# Altium project project1_power_supply.PrjPcb
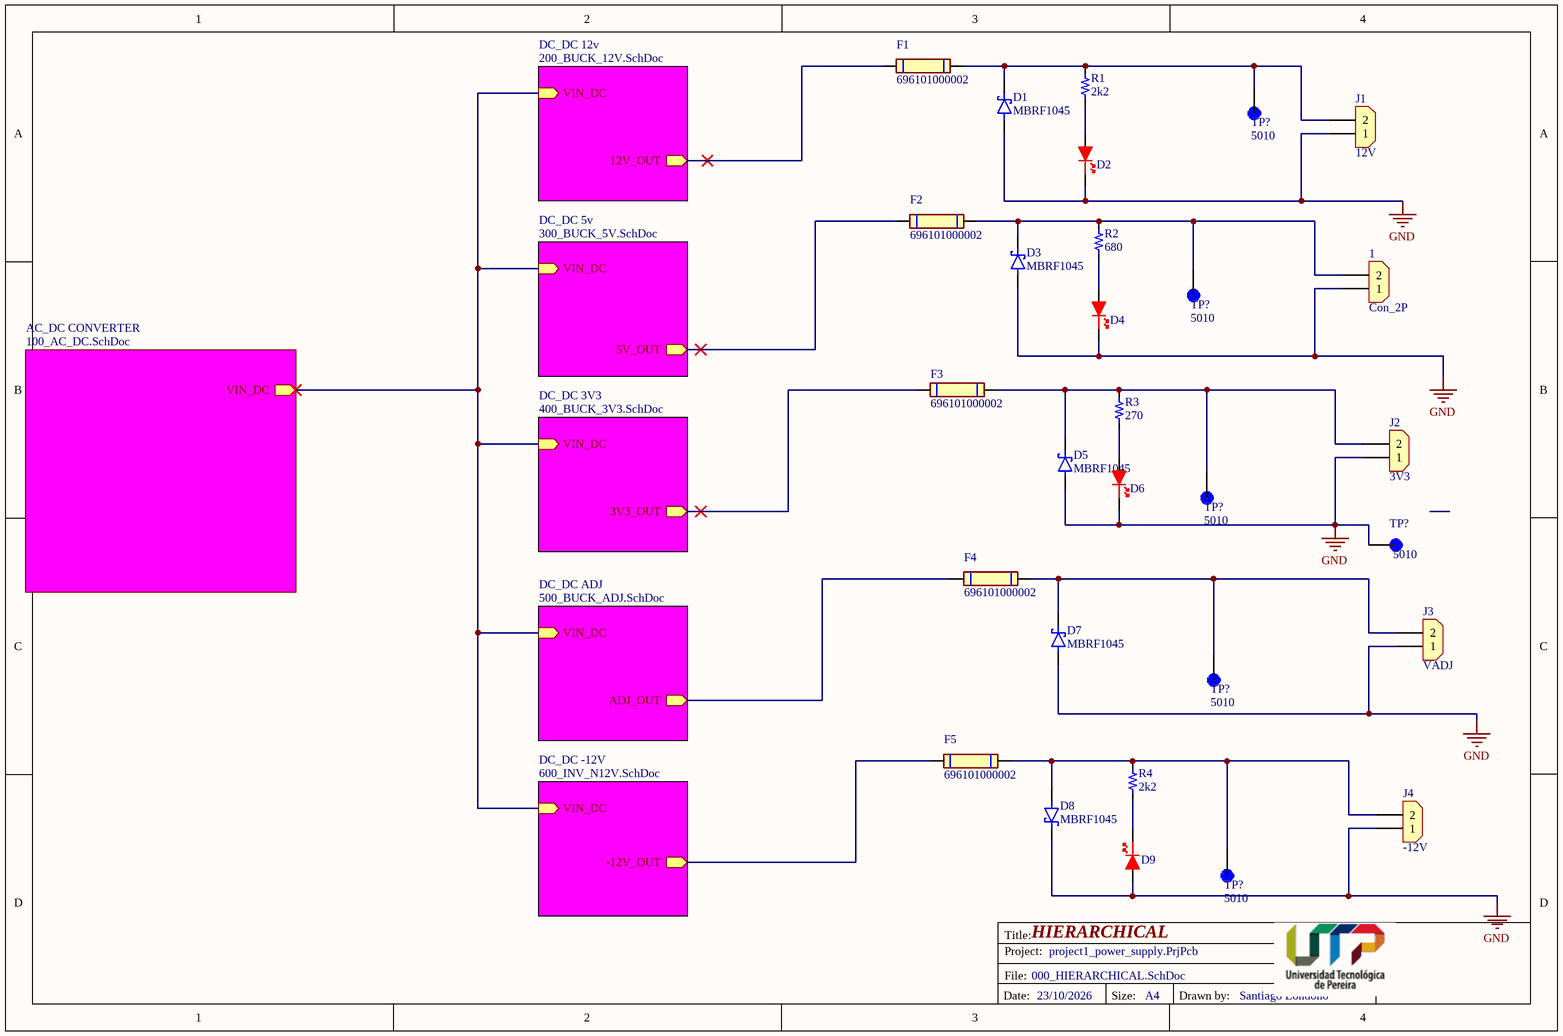
[diagram p0: 000_HIERARCHICAL.SchDoc]
Author: Santiago Londoño
7 sheets, 97 parts. Net scope: hierarchical (ports join the sheet entries above them; power ports are global).
Board file: Main_PCB_V1R0_XXXXXX.PcbDoc
Sheets:
  000_HIERARCHICAL.SchDoc
    AC_DC CONVERTER = 100_AC_DC.SchDoc
    DC_DC 12v = 200_BUCK_12V.SchDoc
    DC_DC 5v = 300_BUCK_5V.SchDoc
    DC_DC 3V3 = 400_BUCK_3V3.SchDoc
    DC_DC ADJ = 500_BUCK_ADJ.SchDoc
    DC_DC -12V = 600_INV_N12V.SchDoc

## Sheet 000_HIERARCHICAL.SchDoc: HIERARCHICAL
size A4; Date: 23/10/2026; DrawnBy: Santiago Londoño; SheetNumber: 0; SheetTotal: 8

### Parts
(Parts that share a designator on the sheet are numbered #1, #2 ... from top to bottom, then left to right.)
1  Con_2P  [CON_2x1_TH_3.5mm_TB]
D1  MBRF1045  [TO508P995X450X1960-2]
D2  LED  [LED_5MM]  (value not drawn)
D3  MBRF1045  [TO508P995X450X1960-2]
D4  LED  [LED_5MM]  (value not drawn)
D5  MBRF1045  [TO508P995X450X1960-2]
D6  LED  [LED_5MM]  (value not drawn)
D7  MBRF1045  [TO508P995X450X1960-2]
D8  MBRF1045  [TO508P995X450X1960-2]
D9  LED  [LED_5MM]  (value not drawn)
F1  696101000002  [696101000002]
F2  696101000002  [696101000002]
F3  696101000002  [696101000002]
F4  696101000002  [696101000002]
F5  696101000002  [696101000002]
J1  12V  [CON_2x1_TH_3.5mm_TB]
J2  3V3  [CON_2x1_TH_3.5mm_TB]
J3  VADJ  [CON_2x1_TH_3.5mm_TB]
J4  -12V  [CON_2x1_TH_3.5mm_TB]
R1  value 2k2  [0603]  (hidden comment: 2k2 1/10W)
R2  value 680  [0603]  (hidden comment: 2k2 1/10W)
R3  value 270  [0603]  (hidden comment: 2k2 1/10W)
R4  value 2k2  [0603]  (hidden comment: 2k2 1/10W)
TP?#1  5010  [TP_5010]
TP?#2  5010  [TP_5010]
TP?#3  5010  [TP_5010]
TP?#4  5010  [TP_5010]
TP?#5  5010  [TP_5010]
TP?#6  5010  [TP_5010]

### Sub-sheets
AC_DC CONVERTER = 100_AC_DC.SchDoc: VIN_DC (out)
DC_DC 3V3 = 400_BUCK_3V3.SchDoc: VIN_DC (in), 3V3_OUT (out)
DC_DC 5v = 300_BUCK_5V.SchDoc: VIN_DC (in), 5V_OUT (out)
DC_DC 12v = 200_BUCK_12V.SchDoc: VIN_DC (in), 12V_OUT (out)
DC_DC -12V = 600_INV_N12V.SchDoc: VIN_DC (in), -12V_OUT (out)
DC_DC ADJ = 500_BUCK_ADJ.SchDoc: VIN_DC (in), ADJ_OUT (out)

### Nets
GND: 1.1 D1.2(A) D2.K D3.2(A) D4.K D5.2(A) D6.K D7.2(A) D8.1(K) D9.A J1.1 J2.1 J3.1 J4.1 TP?#4.TP
3V3_INT: F3.2 ; sheet DC_DC 3V3/3V3_OUT
Net1_2: 1.2 D3.1(K) F2.2 R2.2 TP?#2.TP
NetC100_1: sheet AC_DC CONVERTER/VIN_DC, sheet DC_DC 12v/VIN_DC, sheet DC_DC 5v/VIN_DC, sheet DC_DC 3V3/VIN_DC, sheet DC_DC ADJ/VIN_DC, sheet DC_DC -12V/VIN_DC
NetC201_P: F1.1 ; sheet DC_DC 12v/12V_OUT
NetC301_P: F2.1 ; sheet DC_DC 5v/5V_OUT
NetC501_P: F4.1 ; sheet DC_DC ADJ/ADJ_OUT
NetC602_N: F5.1 ; sheet DC_DC -12V/-12V_OUT
NetD1_1: D1.1(K) F1.2 J1.2 R1.2 TP?#1.TP
NetD2_A: D2.A R1.1
NetD4_A: D4.A R2.1
NetD5_1: D5.1(K) F3.1 J2.2 R3.2 TP?#3.TP
NetD6_A: D6.A R3.1
NetD7_1: D7.1(K) F4.2 J3.2 TP?#5.TP
NetD8_2: D8.2(A) F5.2 J4.2 R4.2 TP?#6.TP
NetD9_K: D9.K R4.1

### Notes on the sheet
- Title:
- Project:
- File:
- Revision:
- Date:
- Size:
- A4
- Drawn by:

### Library data of the parts
1 J1-J4 = Con_2x1_TH_3.5mm: TERM BLK 2POS SIDE ENT 3.5MM PCB; Manufacturer: Würth Elektronik; Manufacturer Part Number: 691214110002; Supplier 1: Digi-Key; Supplier Part Number 1: 732-2747-ND; Last modified by: J.Jaramillo; Last modified date: 20240310; ComponentLink1Description: Digi-key; ComponentLink1URL: https://www.digikey.com/product-detail/en/wurth-electronics-inc/691214110002/732-2747-ND/2508516; Reel Stock: N/A
D2 D4 D6 D9 = LED_5MM_GENERIC_THT: 5mm LED Generic THT
F1-F5 = 696101000002: MF: {'manufacturer': u'W\xfcrth Elektronik'}; Package: None; Price: None; Value: *; MP: 696101000002; Availability: Unavailable
R1-R4 = Res_2k2_0603_1/10W: RES SMD 2.2K OHM 1% 1/10W 0603; Manufacturer: Yageo; Manufacturer Part Number: RC0603FR-072K2L; Reel Stock: N/A; Last modified by: J.Jaramillo; Last modified date: 20240310; ComponentLink1Description: Digi-Key; ComponentLink1URL: https://www.digikey.com/en/products/detail/yageo/RC0603FR-072K2L/727016?s=N4IgTCBcDaIEoGEAMA2JBmAYnAtEg7GANJgAyIAugL5A; Supplier 1: Digi-Key; Supplier Part Number 1: 311-2.20KHRCT-ND
TP?#1-TP?#6 = 5010: Test Point MultiPurpose THM .445 L .125 OD Heat Resistant Nylon 46 Red | Keystone Electronics 5010; SnapEDA_Link: https://www.snapeda.com/parts/5010/Keystone/view-part/?ref=snap; Package: NON STANDARD-1 Keystone; Value: *; MF: Keystone Electronics; MP: 5010; Check_prices: https://www.snapeda.com/parts/5010/Keystone/view-part/?ref=eda
D1 D3 D5 D7 D8 = MBRF1045: Availability: Unavailable; Value: *; Package: None; MP: MBRF1045; Price: None

## Sheet 100_AC_DC.SchDoc: ETAPA AC_DC
size A4; Date: 23/10/2026; DrawnBy: Santiago Londoño; SheetNumber: 1; SheetTotal: 8
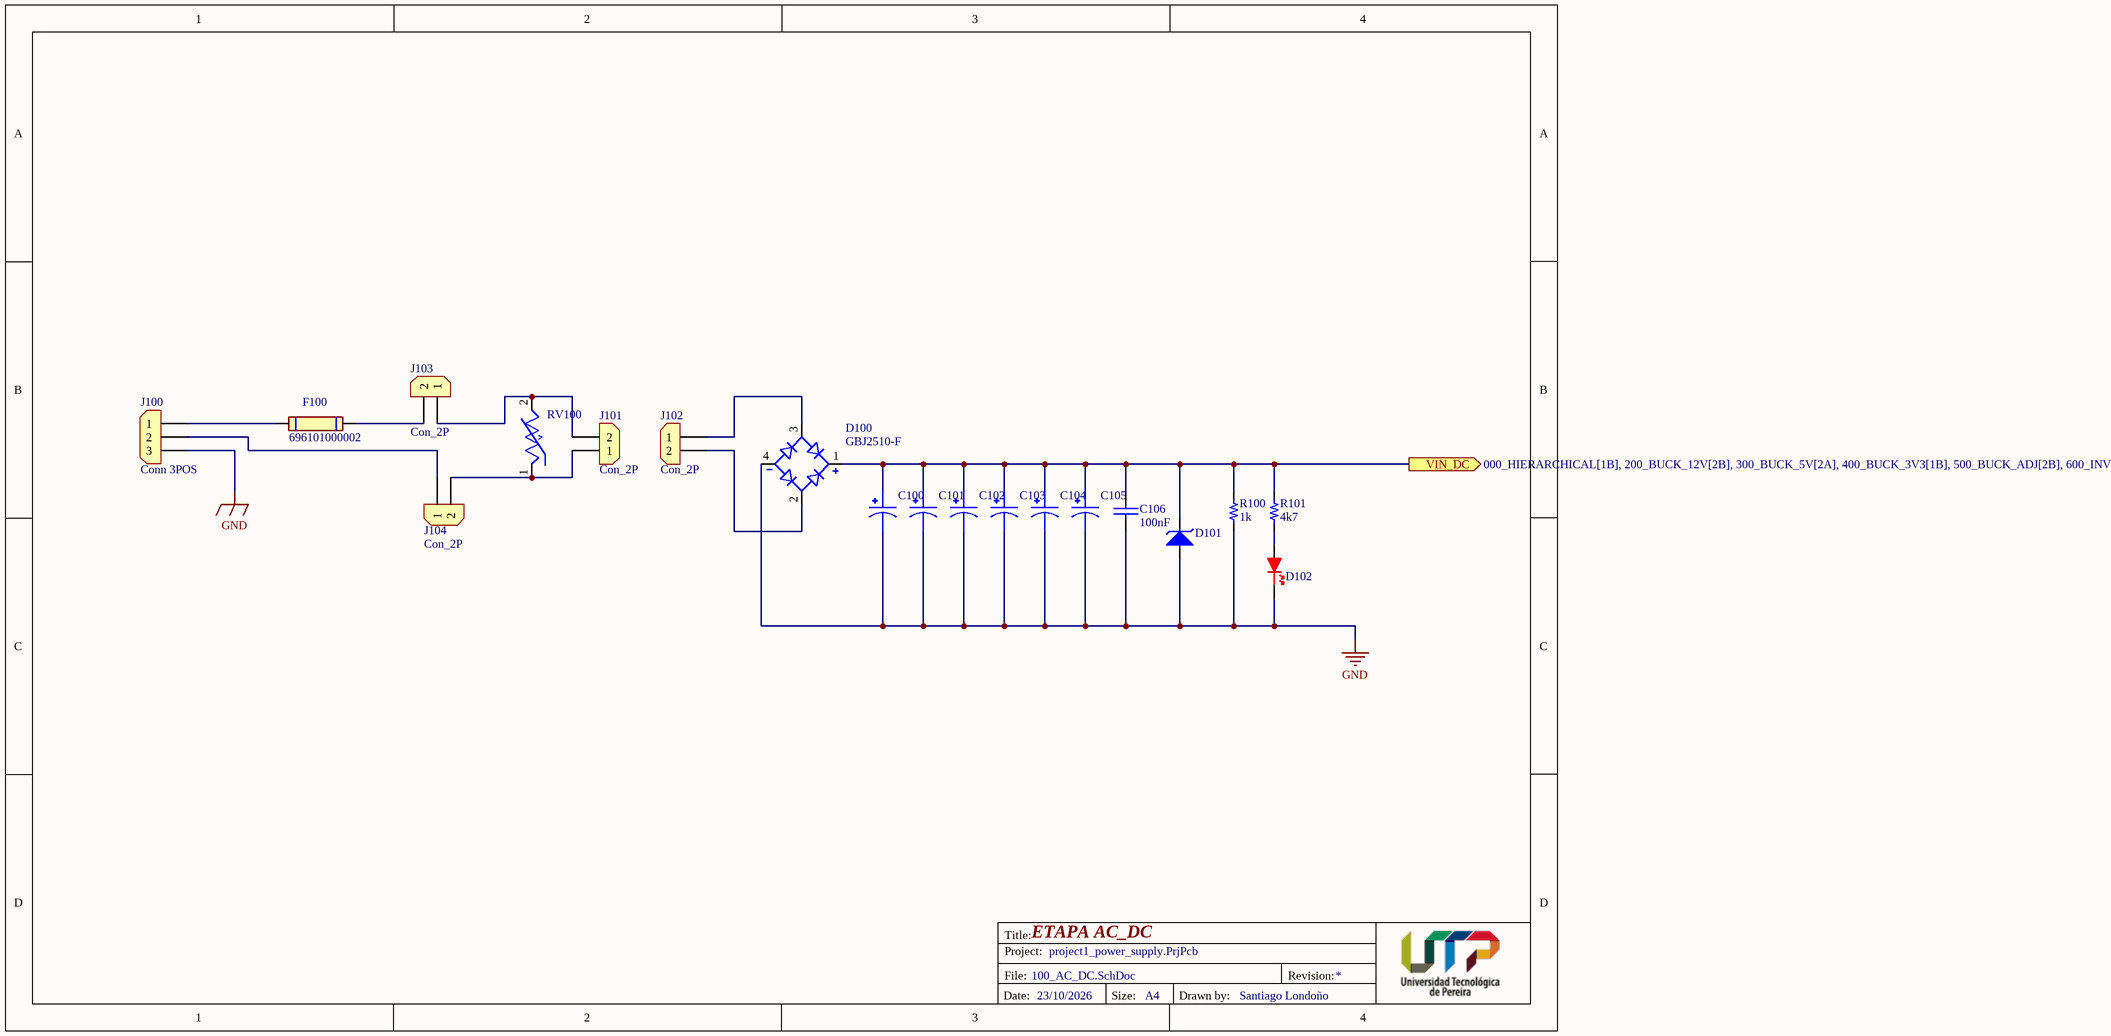
[diagram p1: 100_AC_DC.SchDoc]

### Parts
C100  MAL225638472E3  [CAP_MAL225638472E3]  (value not drawn)
C101  MAL225638472E3  [CAP_MAL225638472E3]  (value not drawn)
C102  MAL225638472E3  [CAP_MAL225638472E3]  (value not drawn)
C103  MAL225638472E3  [CAP_MAL225638472E3]  (value not drawn)
C104  MAL225638472E3  [CAP_MAL225638472E3]  (value not drawn)
C105  MAL225638472E3  [CAP_MAL225638472E3]  (value not drawn)
C106  value 100nF  [1206]  (hidden comment: 100nF 100V)
D100  GBJ2510-F  [DIOB_GBJ2510-F]
D101  38.9V  10.3A  [DO_214AC]  (value not drawn)
D102  LED  [LED_5MM]  (value not drawn)
F100  696101000002  [696101000002]
J100  Conn 3POS  [CON_3x1_TH_5mm]
J101  Con_2P  [CON_2x1_TH_3.5mm_TB]
J102  Con_2P  [CON_2x1_TH_3.5mm_TB]
J103  Con_2P  [CON_2x1_TH_3.5mm_TB]
J104  Con_2P  [CON_2x1_TH_3.5mm_TB]
R100  value 1k  [0201]  (hidden comment: 1k 1/20W)
R101  value 4k7  [0402]  (hidden comment: 4k7 1/16W)
RV100  (no value)  [VAR_B72220S0301K101]

### Ports
VIN_DC (out, see 000_HIERARCHICAL[1B], 200_BUCK_12V[2B], 300_BUCK_5V[2A], 400_BUCK_3V3[1B], 500_BUCK_ADJ[2B], 600_INV_N12V[2B])

### Nets
GND: C100.2 C101.2 C102.2 C103.2 C104.2 C105.2 C106.2 D100.4(NEG) D101.2 D102.K J100.3 R100.1
NetC100_1: C100.1 C101.1 C102.1 C103.1 C104.1 C105.1 C106.1 D100.1(POS) D101.1 R100.2 R101.2 ; port VIN_DC
NetD100_2: D100.2(AC1) J102.2
NetD100_3: D100.3(AC2) J102.1
NetD102_A: D102.A R101.1
NetF100_1: F100.1 J100.1
NetF100_2: F100.2 J103.2
NetJ100_2: J100.2 J104.1
NetJ101_1: J101.1 J104.2 RV100.1
NetJ101_2: J101.2 J103.1 RV100.2

### Notes on the sheet
- Title:
- Project:
- File:
- Revision:
- Date:
- Size:
- A4
- Drawn by:

### Library data of the parts
C106 = Cap_0.1uF_1206_100V: CAP CER 0.1UF 100V X7R 1206; Manufacturer: Samsung Electro-Mechanics; Manufacturer Part Number: CL31B104KCFNNNE; Supplier 1: Digi-Key; Supplier Part Number 1: 1276-1151-1-ND; Last modified by: J.Jaramillo; Last modified date: 20240309; ComponentLink1Description: Digi-Key; ComponentLink1URL: https://www.digikey.com/en/products/detail/samsung-electro-mechanics/CL31B104KCFNNNE/3886809
D100 = GBJ2510-F: Bridge Rectifier Single Phase Standard 1 kV Through Hole GBJ; MF: Diodes Inc.; Package: SIP-4 Diodes Incorporated; Purchase-URL: https://pricing.snapeda.com/search/part/GBJ2510-F/?ref=eda; SnapEDA_Link: https://www.snapeda.com/parts/GBJ2510-F/Diodes+Inc./view-part/?ref=snap; MP: GBJ2510-F; Check_prices: https://www.snapeda.com/parts/GBJ2510-F/Diodes+Inc./view-part/?ref=eda; Digi-Key_Part_Number: GBJ2510-FDI-ND; Value: *
D101 = TVS_38.9V_1CH_DO_214AC: TVS DIODE 24VWM 38.9VC SMA; Manufacturer: Bourns Inc.; Manufacturer Part Number: SMAJ24CA; Supplier 1: Digi-Key; Supplier Part Number 1: SMAJ24CABCT-ND; Reel Sotck: N/A; Last modified by: J.Jaramillo; Last modified date: 20220603; ComponentLink1Description: Digi-Key; ComponentLink1URL: https://www.digikey.com/en/products/detail/bourns-inc/SMAJ24CA/2254533
D102 = LED_5MM_GENERIC_THT: 5mm LED Generic THT
F100 = 696101000002: as F1 on sheet 000_HIERARCHICAL; Package: None; Price: None; Value: *; MP: 696101000002; Availability: Unavailable
J100 = Con_3x1_TH_5.0mm: TERM BLK 3POS SIDE ENTRY 5MM PCB; Manufacturer: Phoenix Contact; Manufacturer Part Number: 1935174; Supplier 1: Digi-Key; Supplier Part Number 1: 277-1578-ND; Reel Stock: N/A; Last modified by: J.Jaramillo; Last modified date: 20240310; ComponentLink1Description: Digi-Key; ComponentLink1URL: https://www.digikey.com/product-detail/en/phoenix-contact/1935174/277-1578-ND/568615
J101-J104 = Con_2x1_TH_3.5mm: as 1 on sheet 000_HIERARCHICAL; Supplier 1: Digi-Key; Supplier Part Number 1: 732-2747-ND; Last modified by: J.Jaramillo; Last modified date: 20240310; ComponentLink1Description: Digi-key; ComponentLink1URL: https://www.digikey.com/product-detail/en/wurth-electronics-inc/691214110002/732-2747-ND/2508516; Reel Stock: N/A
R100 = Res_1k_0201_1/20W: RES 1K OHM 1% 1/20W 0201; Manufacturer: YAGEO; Manufacturer Part Number: RC0201FR-071KL; Supplier 1: Digi-Key; Supplier Part Number 1: 311-1KMCT-ND; Reel Stock: N/A; Last modified by: J.Jaramillo; Last modified date: 20240310; ComponentLink1Description: Digi-Key; ComponentLink1URL: https://www.digikey.com/en/products/detail/yageo/RC0201FR-071KL/3202389?s=N4IgTCBcDaIMwEYEFoEGkCyBhAKsgcgCIgC6AvkA
R101 = Res_4k7_0402_1/16W: RES SMD 4.7K OHM 5% 1/16W 0402; Manufacturer: Yageo; Manufacturer Part Number: RC0402JR-074K7L; Supplier 1: Digi-Key; Supplier Part Number 1: 311-4.7KJRCT-ND; Reel Stock: N/A; Last modified by: J.Jaramillo; Last modified date: 20240310; ComponentLink1Description: Digi-Key; ComponentLink1URL: https://www.digikey.com/product-detail/en/yageo/RC0402JR-074K7L/311-4-7KJRCT-ND/729424
RV100 = B72220S0301K101: Varistor: metal-oxide; THT; 300VAC; 385VDC; 470V; 8000A; 173J; MF: EPCOS; SnapEDA_Link: https://www.snapeda.com/parts/B72220S0301K101/EPCOS/view-part/?ref=snap; Package: Disc-20 EPCOS - TDK Electronics; Value: *; MP: B72220S0301K101; Check_prices: https://www.snapeda.com/parts/B72220S0301K101/EPCOS/view-part/?ref=eda
C100-C105 = MAL225638472E3: Package: None; Price: None; Value: *; MP: MAL225638472E3; Availability: Unavailable

## Sheet 200_BUCK_12V.SchDoc: CONVERTIDOR BUCK 12V
size A4; Date: 23/10/2026; Author: Santiago Londoño; DrawnBy: Santiago Londoño; SheetNumber: 2; SheetTotal: 8
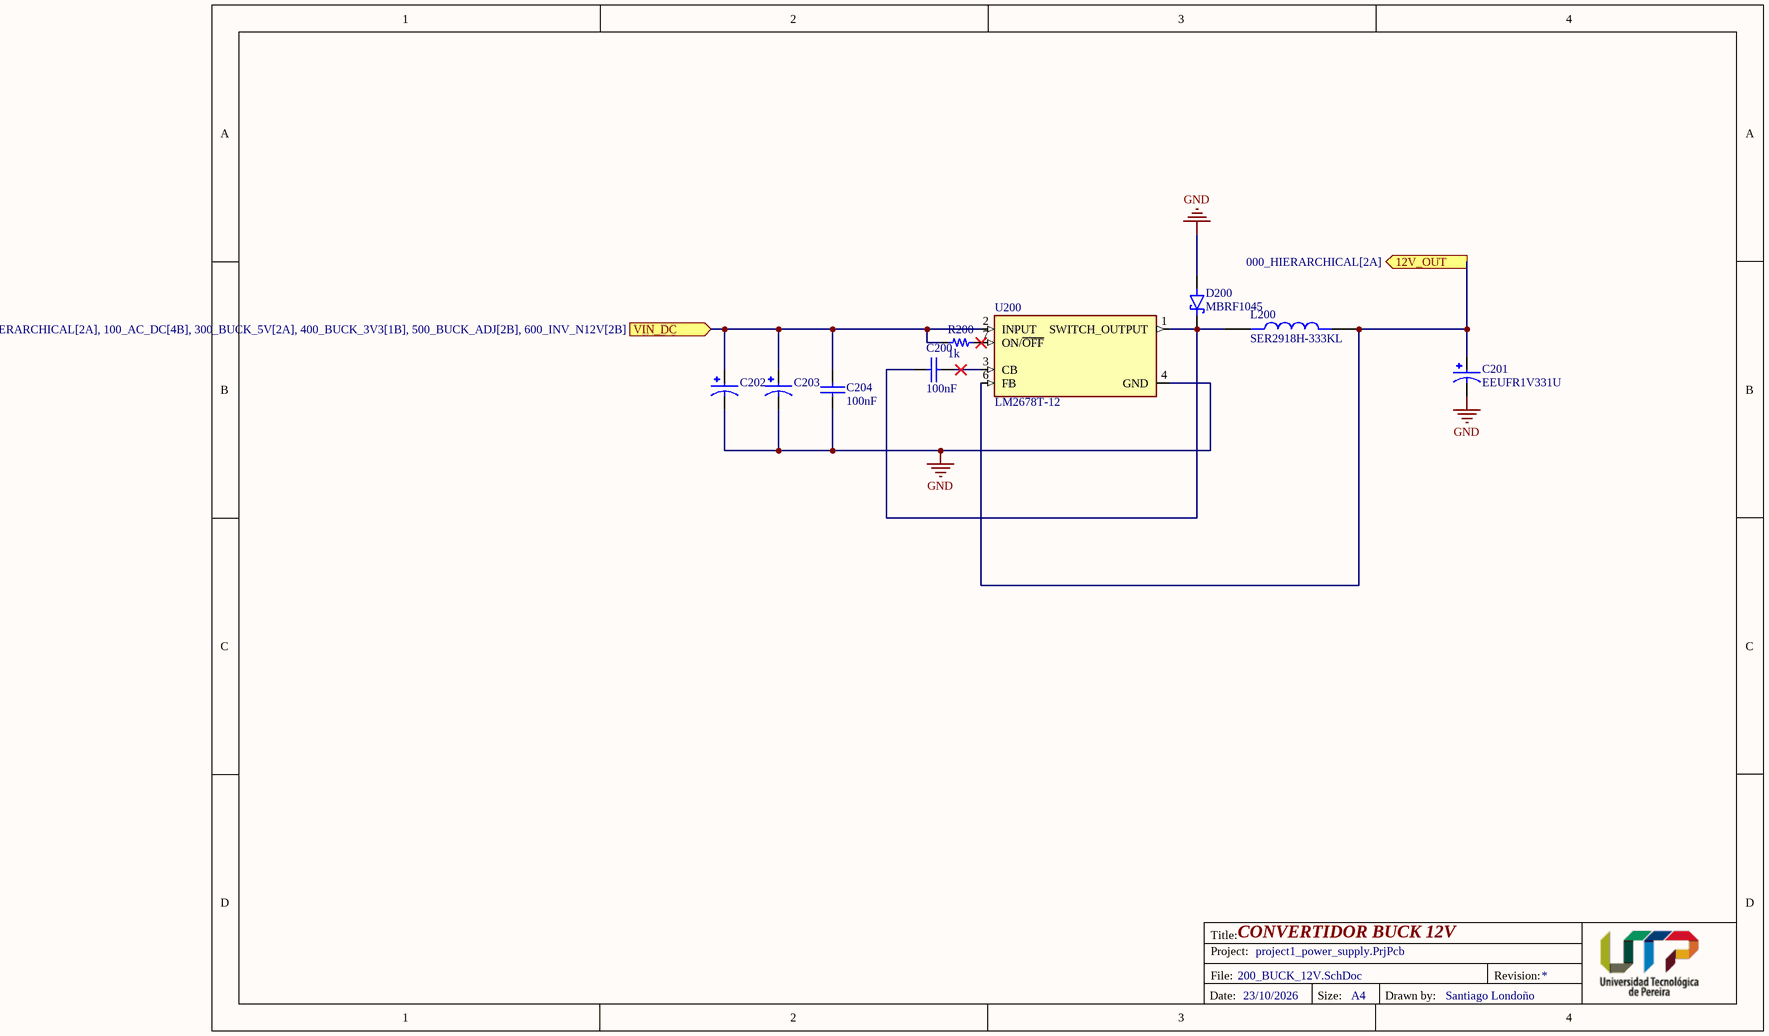
[diagram p2: 200_BUCK_12V.SchDoc]

### Parts
C200  value 100nF  [1206]  (hidden comment: 100nF 100V)
C201  EEUFR1V331U  [CAPPRD500W60D1000H1250]
C202  EEUFR1H561B  [CAPPRD500W60D1250H2500]  (value not drawn)
C203  EEUFR1H561B  [CAPPRD500W60D1250H2500]  (value not drawn)
C204  value 100nF  [1206]  (hidden comment: 100nF 100V)
D200  MBRF1045  [TO508P995X450X1960-2]
L200  SER2918H-333KL  [IND_SER2918H-333KL]
R200  value 1k  [0201]  (hidden comment: 1k 1/20W)
U200  LM2678T-12  [TO127P1041X469X2199-7N]

### Ports
12V_OUT (out, see 000_HIERARCHICAL[2A]), VIN_DC (in, see 000_HIERARCHICAL[2A], 100_AC_DC[4B], 300_BUCK_5V[2A], 400_BUCK_3V3[1B], 500_BUCK_ADJ[2B], 600_INV_N12V[2B])

### Nets
GND: C201.N C202.N C203.N C204.2 D200.2(A) U200.4(GND)
NetC100_1: C202.P C203.P C204.1 R200.2 U200.2(INPUT) ; port VIN_DC
NetC200_1: C200.1 D200.1(K) L200.1 U200.1(SWITCH_OUTPUT)
NetC200_2: C200.2 U200.3(CB)
NetC201_P: C201.P L200.2 U200.6(FB) ; port 12V_OUT
NetR200_1: R200.1 U200.7(ON/~{OFF})

### Notes on the sheet
- Title:
- Project:
- File:
- Revision:
- Date:
- Size:
- A4
- Drawn by:

### Library data of the parts
C200 C204 = Cap_0.1uF_1206_100V: as C106 on sheet 100_AC_DC; Supplier 1: Digi-Key; Supplier Part Number 1: 1276-1151-1-ND; Last modified by: J.Jaramillo; Last modified date: 20240309; ComponentLink1Description: Digi-Key; ComponentLink1URL: https://www.digikey.com/en/products/detail/samsung-electro-mechanics/CL31B104KCFNNNE/3886809
C201 = EEUFR1V331U: CAP ALUM 330UF 20% 35V RADIAL TH; MF: Panasonic; Check_prices: https://www.snapeda.com/parts/EEUFR1V331U/Panasonic/view-part/?ref=eda; Value: *; Purchase-URL: https://pricing.snapeda.com/search/part/EEUFR1V331U/?ref=eda; Price: None; MP: EEUFR1V331U; SnapEDA_Link: https://www.snapeda.com/parts/EEUFR1V331U/Panasonic/view-part/?ref=snap; Availability: In Stock; Package: RADIAL-2 Panasonic
C202 C203 = EEUFR1H561B: MF: {'manufacturer': u'Panasonic Electronic Components'}; Package: None; Price: None; Value: *; MP: EEUFR1H561B; Availability: Unavailable
L200 = SER2918H-333KL: INDUCTOR, PWR, 33UH, 28A, 0.1, 10MHZ; Product Range:COILCRAFT - SER2900 Series; Inductance:33ÂµH; Inductance Tolerance:Â± 10%; Inductor Construction:Shielded; DC Resistance Max:2860Âµohm; RMS Current (Irms):28A; Saturation Current (Isat):7A; Case Dimensio; SnapEDA_Link: https://www.snapeda.com/parts/SER2918H-333KL/Coilcraft/view-part/?ref=snap; Package: None; Value: *; MF: Coilcraft; MP: SER2918H-333KL; Check_prices: https://www.snapeda.com/parts/SER2918H-333KL/Coilcraft/view-part/?ref=eda
R200 = Res_1k_0201_1/20W: as R100 on sheet 100_AC_DC; Supplier 1: Digi-Key; Supplier Part Number 1: 311-1KMCT-ND; Reel Stock: N/A; Last modified by: J.Jaramillo; Last modified date: 20240310; ComponentLink1Description: Digi-Key; ComponentLink1URL: https://www.digikey.com/en/products/detail/yageo/RC0201FR-071KL/3202389?s=N4IgTCBcDaIMwEYEFoEGkCyBhAKsgcgCIgC6AvkA
U200 = LM2678T-ADJ: 8V to 40V, 5A SIMPLE SWITCHER buck converter with high efficiency 7-TO-220 -40 to 125; MF: Texas Instruments; SnapEDA_Link: https://www.snapeda.com/parts/LM2678T-ADJ/Texas+Instruments/view-part/?ref=snap; Package: TO-220-7 Texas Instruments; Value: *; MP: LM2678T-ADJ; Check_prices: https://www.snapeda.com/parts/LM2678T-ADJ/Texas+Instruments/view-part/?ref=eda
D200 = MBRF1045: Availability: Unavailable; Value: *; Package: None; MP: MBRF1045; Price: None

## Sheet 300_BUCK_5V.SchDoc: CONVERTIDOR BUCK 5V
size A4; Date: 23/10/2026; DrawnBy: Santiago Londoño; SheetNumber: 3; SheetTotal: 8
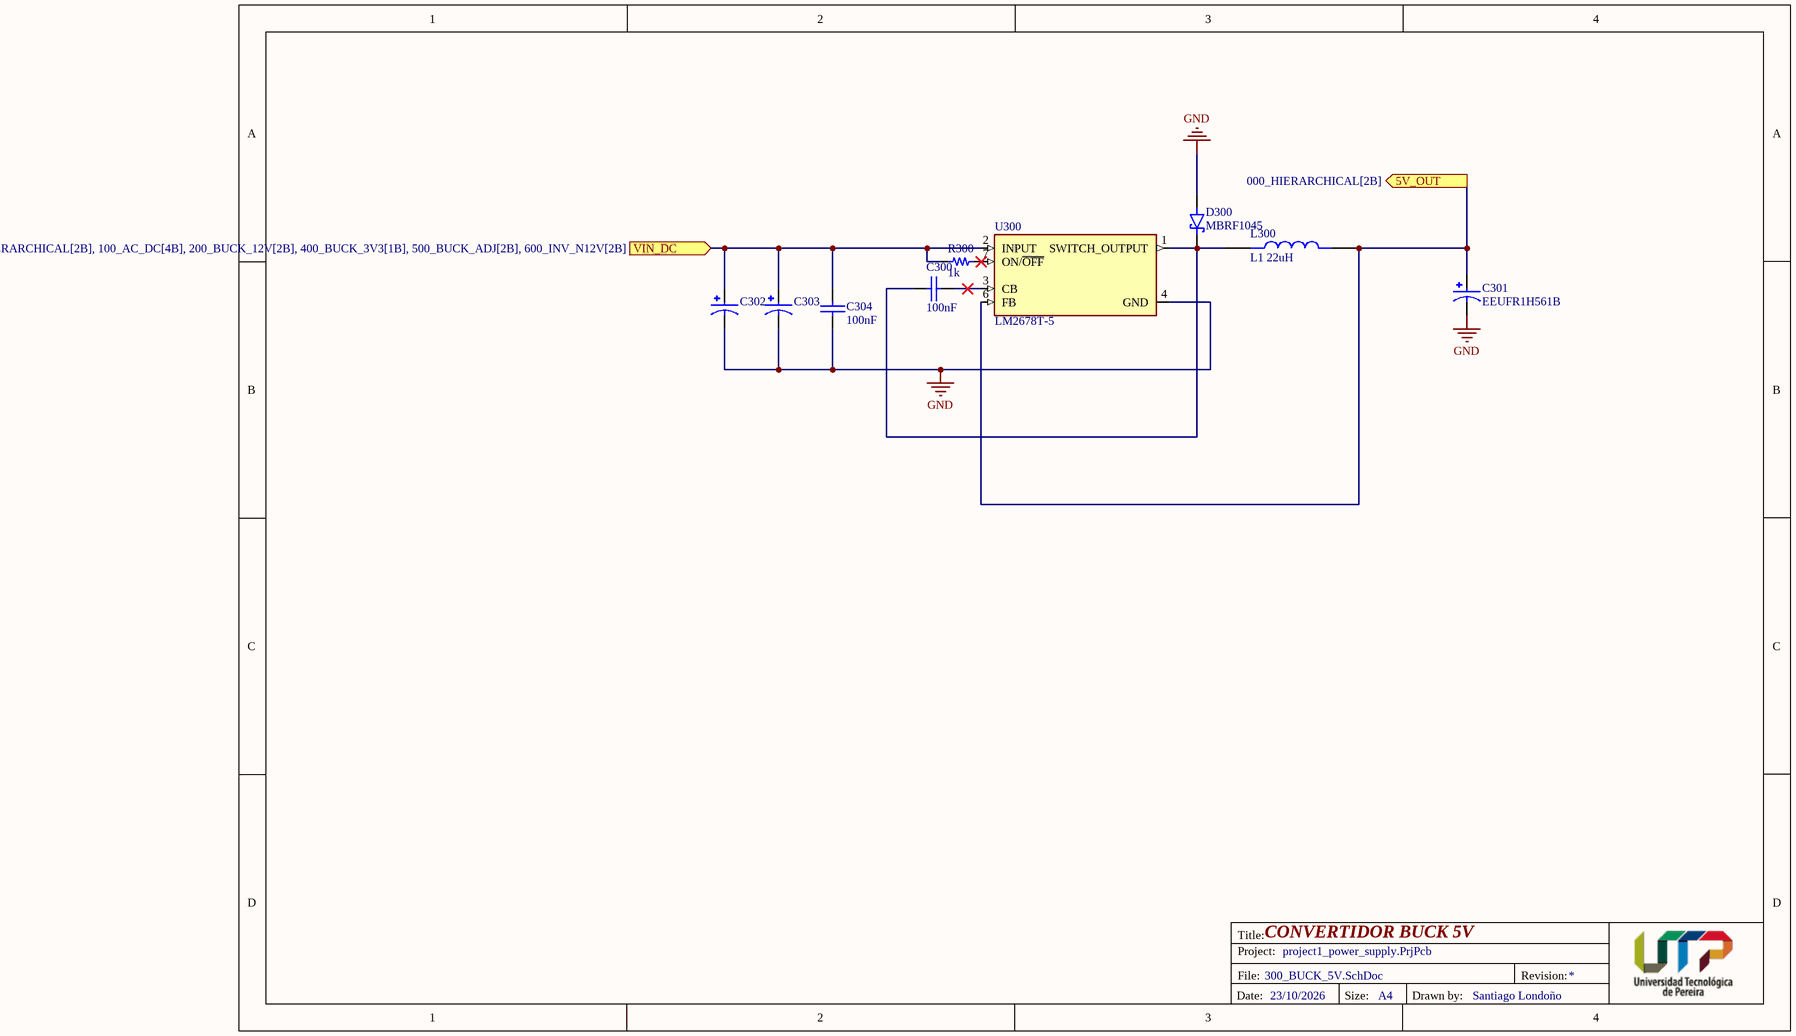
[diagram p3: 300_BUCK_5V.SchDoc]

### Parts
C300  value 100nF  [1206]  (hidden comment: 100nF 100V)
C301  EEUFR1H561B  [CAPPRD500W60D1250H2500]
C302  EEUFR1H561B  [CAPPRD500W60D1250H2500]  (value not drawn)
C303  EEUFR1H561B  [CAPPRD500W60D1250H2500]  (value not drawn)
C304  value 100nF  [1206]  (hidden comment: 100nF 100V)
D300  MBRF1045  [TO508P995X450X1960-2]
L300  L1 22uH  [IND_SER2918H-333KL]
R300  value 1k  [0201]  (hidden comment: 1k 1/20W)
U300  LM2678T-5  [TO127P1041X469X2199-7N]

### Ports
5V_OUT (out, see 000_HIERARCHICAL[2B]), VIN_DC (in, see 000_HIERARCHICAL[2B], 100_AC_DC[4B], 200_BUCK_12V[2B], 400_BUCK_3V3[1B], 500_BUCK_ADJ[2B], 600_INV_N12V[2B])

### Nets
GND: C301.N C302.N C303.N C304.2 D300.2(A) U300.4(GND)
NetC100_1: C302.P C303.P C304.1 R300.2 U300.2(INPUT) ; port VIN_DC
NetC300_1: C300.1 D300.1(K) L300.1 U300.1(SWITCH_OUTPUT)
NetC300_2: C300.2 U300.3(CB)
NetC301_P: C301.P L300.2 U300.6(FB) ; port 5V_OUT
NetR300_1: R300.1 U300.7(ON/~{OFF})

### Notes on the sheet
- Title:
- Project:
- File:
- Revision:
- Date:
- Size:
- A4
- Drawn by:

### Library data of the parts
C300 C304 = Cap_0.1uF_1206_100V: as C106 on sheet 100_AC_DC; Supplier 1: Digi-Key; Supplier Part Number 1: 1276-1151-1-ND; Last modified by: J.Jaramillo; Last modified date: 20240309; ComponentLink1Description: Digi-Key; ComponentLink1URL: https://www.digikey.com/en/products/detail/samsung-electro-mechanics/CL31B104KCFNNNE/3886809
C301-C303 = EEUFR1H561B: as C202 on sheet 200_BUCK_12V; Package: None; Price: None; Value: *; MP: EEUFR1H561B; Availability: Unavailable
L300 = SER2918H-333KL: as L200 on sheet 200_BUCK_12V; SnapEDA_Link: https://www.snapeda.com/parts/SER2918H-333KL/Coilcraft/view-part/?ref=snap; Package: None; Value: *; MF: Coilcraft; MP: SER2918H-333KL; Check_prices: https://www.snapeda.com/parts/SER2918H-333KL/Coilcraft/view-part/?ref=eda
R300 = Res_1k_0201_1/20W: as R100 on sheet 100_AC_DC; Supplier 1: Digi-Key; Supplier Part Number 1: 311-1KMCT-ND; Reel Stock: N/A; Last modified by: J.Jaramillo; Last modified date: 20240310; ComponentLink1Description: Digi-Key; ComponentLink1URL: https://www.digikey.com/en/products/detail/yageo/RC0201FR-071KL/3202389?s=N4IgTCBcDaIMwEYEFoEGkCyBhAKsgcgCIgC6AvkA
U300 = LM2678T-ADJ: as U200 on sheet 200_BUCK_12V; SnapEDA_Link: https://www.snapeda.com/parts/LM2678T-ADJ/Texas+Instruments/view-part/?ref=snap; Package: TO-220-7 Texas Instruments; Value: *; MP: LM2678T-ADJ; Check_prices: https://www.snapeda.com/parts/LM2678T-ADJ/Texas+Instruments/view-part/?ref=eda
D300 = MBRF1045: Availability: Unavailable; Value: *; Package: None; MP: MBRF1045; Price: None

## Sheet 400_BUCK_3V3.SchDoc: CONVERTIDOR BUCK 3V3V
size A4; Date: 23/10/2026; DrawnBy: Santiago Londoño; SheetNumber: 4; SheetTotal: 8
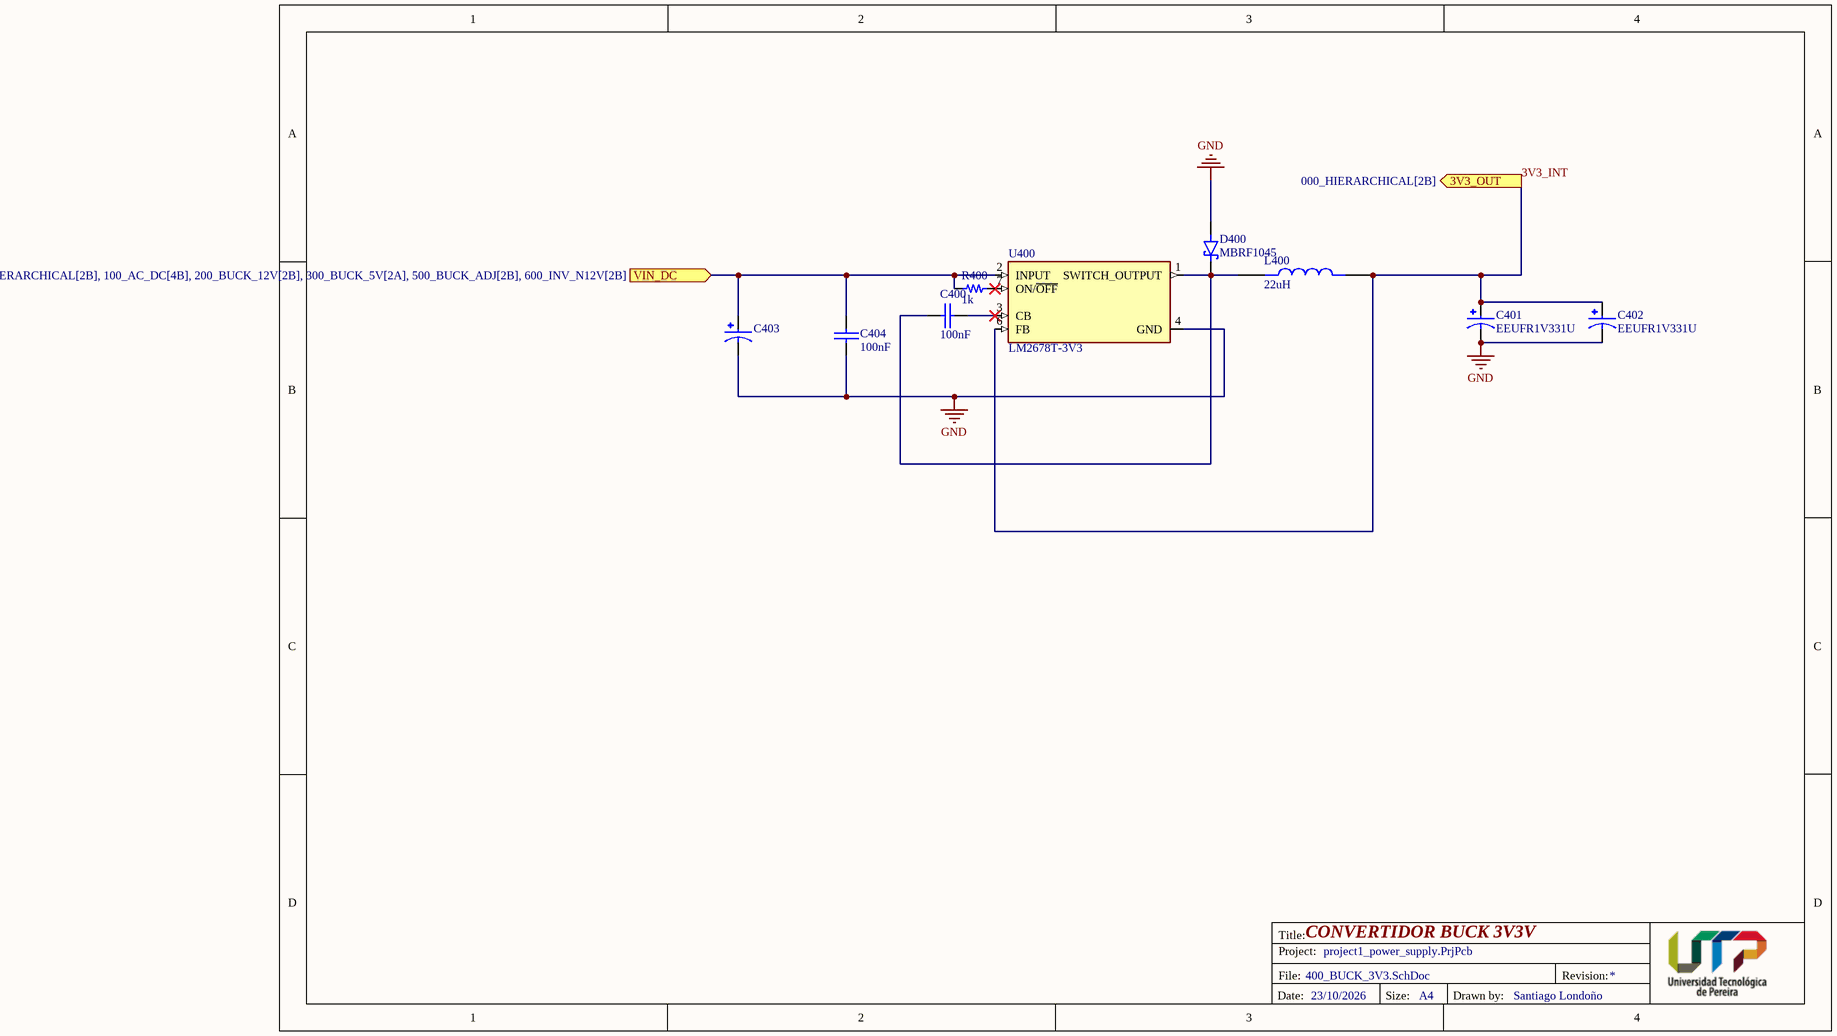
[diagram p4: 400_BUCK_3V3.SchDoc]

### Parts
C400  value 100nF  [1206]  (hidden comment: 100nF 100V)
C401  EEUFR1V331U  [CAPPRD500W60D1000H1250]
C402  EEUFR1V331U  [CAPPRD500W60D1000H1250]
C403  EEUFR1H561B  [CAPPRD500W60D1250H2500]  (value not drawn)
C404  value 100nF  [1206]  (hidden comment: 100nF 100V)
D400  MBRF1045  [TO508P995X450X1960-2]
L400  22uH  [IND_SER2918H-333KL]
R400  value 1k  [0201]  (hidden comment: 1k 1/20W)
U400  LM2678T-3V3  [TO127P1041X469X2199-7N]

### Ports
3V3_OUT (out, see 000_HIERARCHICAL[2B]), VIN_DC (in, see 000_HIERARCHICAL[2B], 100_AC_DC[4B], 200_BUCK_12V[2B], 300_BUCK_5V[2A], 500_BUCK_ADJ[2B], 600_INV_N12V[2B])

### Nets
GND: C401.N C402.N C403.N C404.2 D400.2(A) U400.4(GND)
3V3_INT: C401.P C402.P L400.2 U400.6(FB) ; port 3V3_OUT
NetC100_1: C403.P C404.1 R400.2 U400.2(INPUT) ; port VIN_DC
NetC400_1: C400.1 D400.1(K) L400.1 U400.1(SWITCH_OUTPUT)
NetC400_2: C400.2 U400.3(CB)
NetR400_1: R400.1 U400.7(ON/~{OFF})

### Notes on the sheet
- Title:
- Project:
- File:
- Revision:
- Date:
- Size:
- A4
- Drawn by:

### Library data of the parts
C400 C404 = Cap_0.1uF_1206_100V: as C106 on sheet 100_AC_DC; Supplier 1: Digi-Key; Supplier Part Number 1: 1276-1151-1-ND; Last modified by: J.Jaramillo; Last modified date: 20240309; ComponentLink1Description: Digi-Key; ComponentLink1URL: https://www.digikey.com/en/products/detail/samsung-electro-mechanics/CL31B104KCFNNNE/3886809
C401 C402 = EEUFR1V331U: as C201 on sheet 200_BUCK_12V; Check_prices: https://www.snapeda.com/parts/EEUFR1V331U/Panasonic/view-part/?ref=eda; Value: *; Purchase-URL: https://pricing.snapeda.com/search/part/EEUFR1V331U/?ref=eda; Price: None; MP: EEUFR1V331U; SnapEDA_Link: https://www.snapeda.com/parts/EEUFR1V331U/Panasonic/view-part/?ref=snap; Availability: In Stock; Package: RADIAL-2 Panasonic
C403 = EEUFR1H561B: as C202 on sheet 200_BUCK_12V; Package: None; Price: None; Value: *; MP: EEUFR1H561B; Availability: Unavailable
L400 = SER2918H-333KL: as L200 on sheet 200_BUCK_12V; SnapEDA_Link: https://www.snapeda.com/parts/SER2918H-333KL/Coilcraft/view-part/?ref=snap; Package: None; Value: *; MF: Coilcraft; MP: SER2918H-333KL; Check_prices: https://www.snapeda.com/parts/SER2918H-333KL/Coilcraft/view-part/?ref=eda
R400 = Res_1k_0201_1/20W: as R100 on sheet 100_AC_DC; Supplier 1: Digi-Key; Supplier Part Number 1: 311-1KMCT-ND; Reel Stock: N/A; Last modified by: J.Jaramillo; Last modified date: 20240310; ComponentLink1Description: Digi-Key; ComponentLink1URL: https://www.digikey.com/en/products/detail/yageo/RC0201FR-071KL/3202389?s=N4IgTCBcDaIMwEYEFoEGkCyBhAKsgcgCIgC6AvkA
U400 = LM2678T-ADJ: as U200 on sheet 200_BUCK_12V; SnapEDA_Link: https://www.snapeda.com/parts/LM2678T-ADJ/Texas+Instruments/view-part/?ref=snap; Package: TO-220-7 Texas Instruments; Value: *; MP: LM2678T-ADJ; Check_prices: https://www.snapeda.com/parts/LM2678T-ADJ/Texas+Instruments/view-part/?ref=eda
D400 = MBRF1045: Availability: Unavailable; Value: *; Package: None; MP: MBRF1045; Price: None

## Sheet 500_BUCK_ADJ.SchDoc: CONVERTIDOR AJUSTABLE
size A4; Date: 23/10/2026; DrawnBy: Santiago Londoño; SheetNumber: 5; SheetTotal: 8
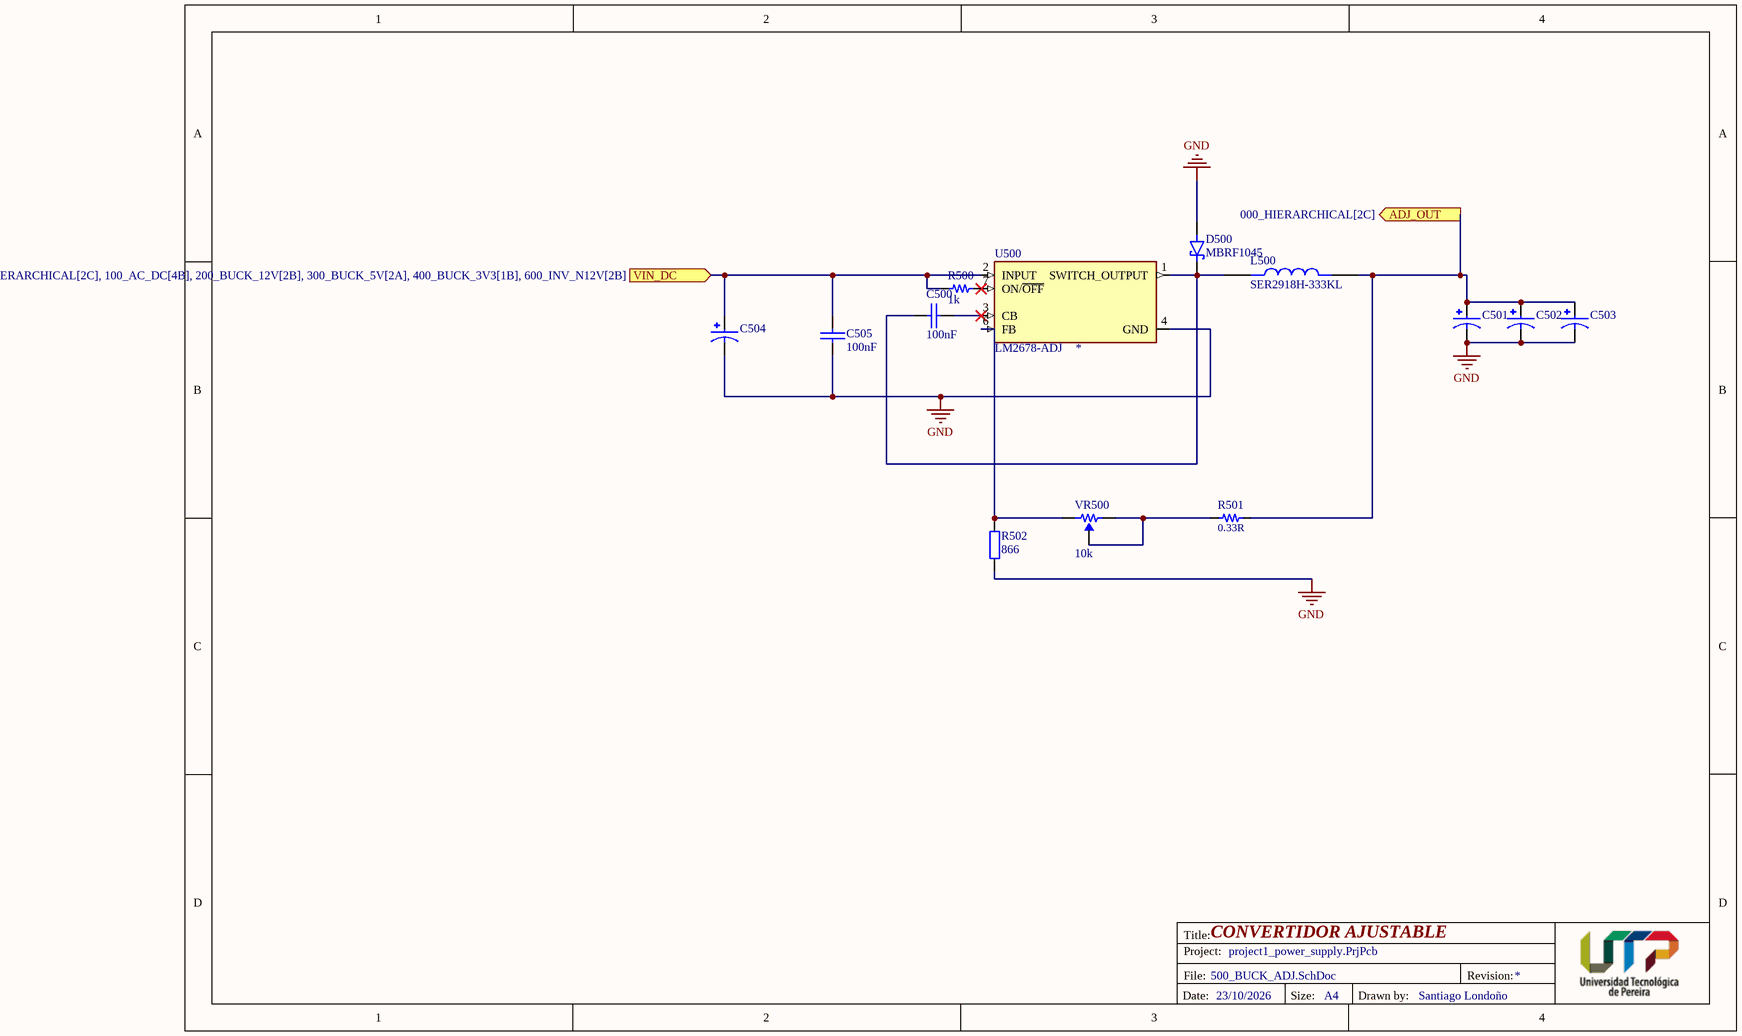
[diagram p5: 500_BUCK_ADJ.SchDoc]

### Parts
C500  value 100nF  [1206]  (hidden comment: 100nF 100V)
C501  EEUFR1H561B  [CAPPRD500W60D1250H2500]  (value not drawn)
C502  EEUFR1H561B  [CAPPRD500W60D1250H2500]  (value not drawn)
C503  EEUFR1H561B  [CAPPRD500W60D1250H2500]  (value not drawn)
C504  EEUFR1H561B  [CAPPRD500W60D1250H2500]  (value not drawn)
C505  value 100nF  [1206]  (hidden comment: 100nF 100V)
D500  MBRF1045  [TO508P995X450X1960-2]
L500  SER2918H-333KL  [IND_SER2918H-333KL]
R500  value 1k  [0201]  (hidden comment: 1k 1/20W)
R501  value 0.33R  [1206]  (hidden comment: 0R33 3/4W)
R502  866  [RES_0805]
U500  LM2678-ADJ  [TO127P1041X469X2199-7N]
VR500  value 10k  [Pot_3x1_5mm_TH]  (hidden comment: 10k 1/5W)

### Ports
ADJ_OUT (out, see 000_HIERARCHICAL[2C]), VIN_DC (in, see 000_HIERARCHICAL[2C], 100_AC_DC[4B], 200_BUCK_12V[2B], 300_BUCK_5V[2A], 400_BUCK_3V3[1B], 600_INV_N12V[2B])

### Nets
GND: C501.N C502.N C503.N C504.N C505.2 D500.2(A) R502.1 U500.4(GND)
NetC100_1: C504.P C505.1 R500.2 U500.2(INPUT) ; port VIN_DC
NetC500_1: C500.1 D500.1(K) L500.1 U500.1(SWITCH_OUTPUT)
NetC500_2: C500.2 U500.3(CB)
NetC501_P: C501.P C502.P C503.P L500.2 R501.2 ; port ADJ_OUT
NetR500_1: R500.1 U500.7(ON/~{OFF})
NetR501_1: R501.1 VR500.1 VR500.2
NetR502_2: R502.2 U500.6(FB) VR500.3

### Notes on the sheet
- Title:
- Project:
- File:
- Revision:
- Date:
- Size:
- A4
- Drawn by:

### Library data of the parts
C500 C505 = Cap_0.1uF_1206_100V: as C106 on sheet 100_AC_DC; Supplier 1: Digi-Key; Supplier Part Number 1: 1276-1151-1-ND; Last modified by: J.Jaramillo; Last modified date: 20240309; ComponentLink1Description: Digi-Key; ComponentLink1URL: https://www.digikey.com/en/products/detail/samsung-electro-mechanics/CL31B104KCFNNNE/3886809
C501-C504 = EEUFR1H561B: as C202 on sheet 200_BUCK_12V; Package: None; Price: None; Value: *; MP: EEUFR1H561B; Availability: Unavailable
L500 = SER2918H-333KL: as L200 on sheet 200_BUCK_12V; SnapEDA_Link: https://www.snapeda.com/parts/SER2918H-333KL/Coilcraft/view-part/?ref=snap; Package: None; Value: *; MF: Coilcraft; MP: SER2918H-333KL; Check_prices: https://www.snapeda.com/parts/SER2918H-333KL/Coilcraft/view-part/?ref=eda
R500 = Res_1k_0201_1/20W: as R100 on sheet 100_AC_DC; Supplier 1: Digi-Key; Supplier Part Number 1: 311-1KMCT-ND; Reel Stock: N/A; Last modified by: J.Jaramillo; Last modified date: 20240310; ComponentLink1Description: Digi-Key; ComponentLink1URL: https://www.digikey.com/en/products/detail/yageo/RC0201FR-071KL/3202389?s=N4IgTCBcDaIMwEYEFoEGkCyBhAKsgcgCIgC6AvkA
R501 = Res_0R33_1206_3/4W: RES 0.33 OHM 1% 3/4W 1206; Manufacturer: Susumu; Manufacturer Part Number: KRL1632E-M-R330-F-T5; Reel Stock: N/A; Last modified by: J.Jaramillo; Last modified date: 20240310; ComponentLink1Description: Digi-key; ComponentLink1URL: https://www.digikey.com/products/en?keywords=408-1588-1-ND; Supplier 1: Digi-Key; Supplier Part Number 1: 408-1588-1-ND
R502 = RES_0805: Resistor SMD 0805; Manufacturer: *; Manufacturer Part Number: *; Distributor Link: *; LCSC: *
U500 = LM2678T-ADJ: as U200 on sheet 200_BUCK_12V; SnapEDA_Link: https://www.snapeda.com/parts/LM2678T-ADJ/Texas+Instruments/view-part/?ref=snap; Package: TO-220-7 Texas Instruments; Value: *; MP: LM2678T-ADJ; Check_prices: https://www.snapeda.com/parts/LM2678T-ADJ/Texas+Instruments/view-part/?ref=eda
VR500 = Pot_10k_1/5W_TH: POT 10K OHM 1/5W PLASTIC LINEAR; Manufacturer: TT Electronics/BI; Manufacturer Part Number: P160KN-0QC15B10K; Reel Stock: N/A; Last modified by: J.Jaramillo; Last modified date: 20240310; ComponentLink1Description: Digi-key; ComponentLink1URL: https://www.digikey.com/products/en?keywords=P160KN-0QC15B10K; Supplier 1: Digi-Key; Supplier Part Number 1: 987-1301-ND
D500 = MBRF1045: Availability: Unavailable; Value: *; Package: None; MP: MBRF1045; Price: None

## Sheet 600_INV_N12V.SchDoc: CONVERTIDOR INVERSOR -12V
size A4; Date: 23/10/2026; DrawnBy: Santiago Londoño; SheetNumber: 6; SheetTotal: 8
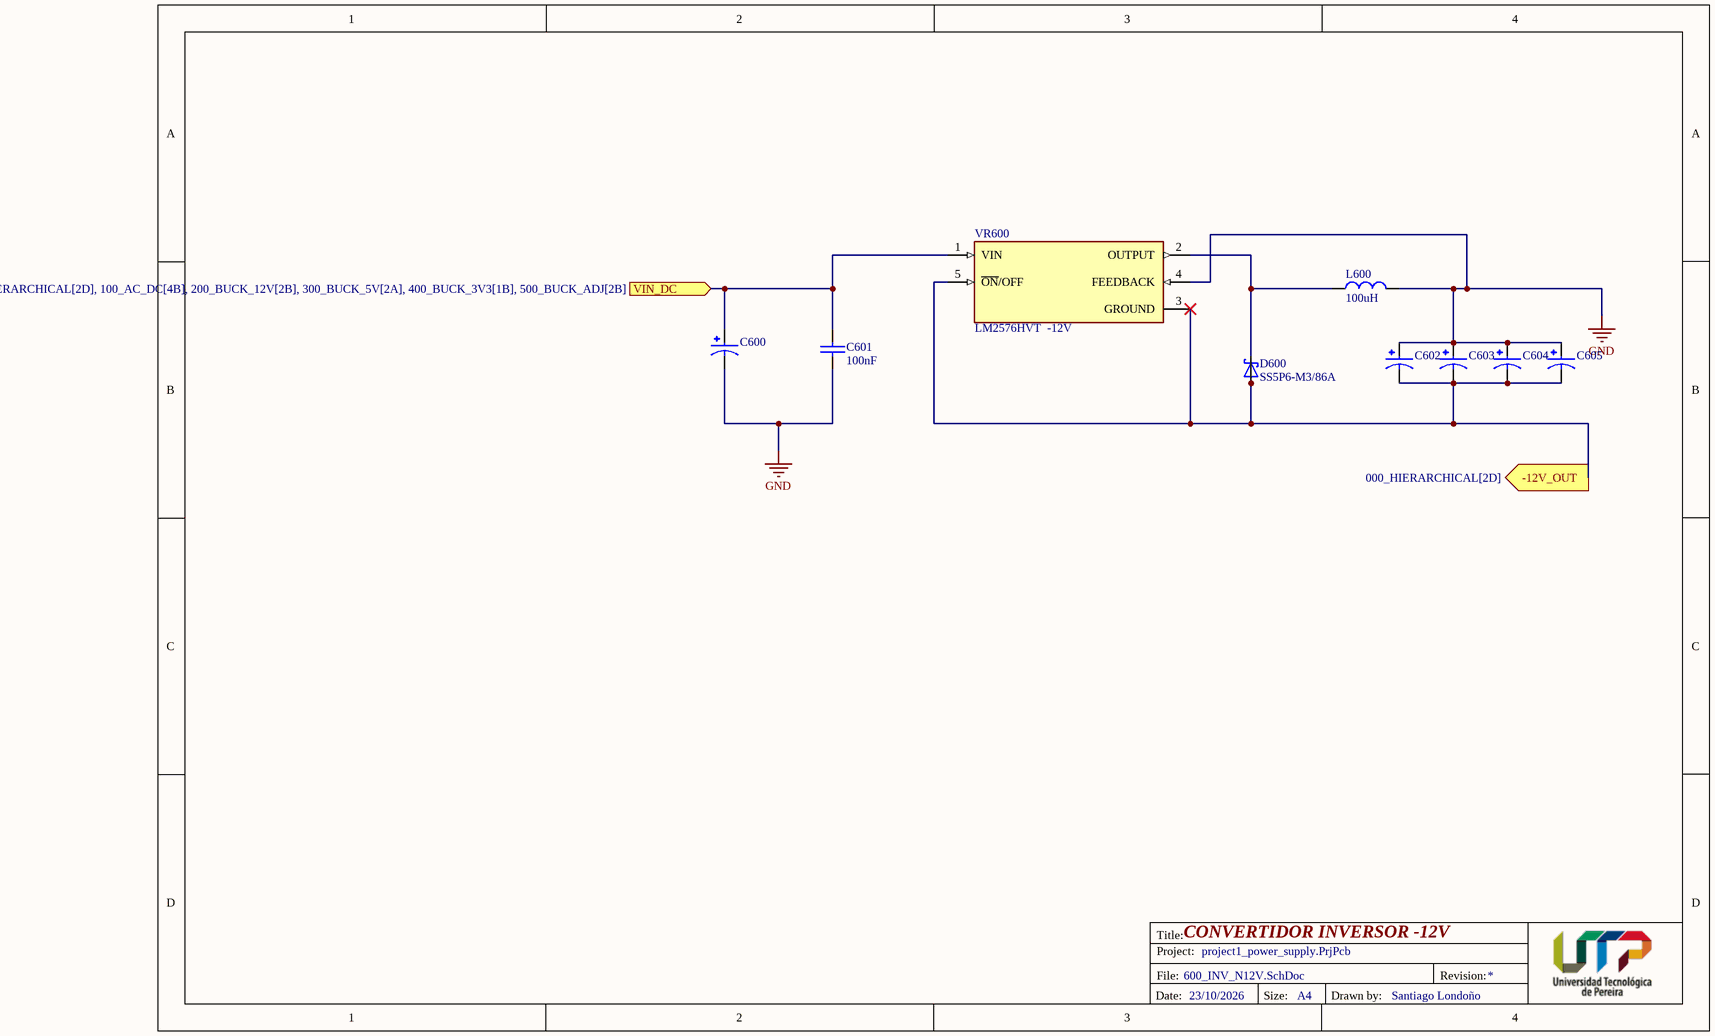
[diagram p6: 600_INV_N12V.SchDoc]

### Parts
C600  EEUFR1H561B  [CAPPRD500W60D1250H2500]  (value not drawn)
C601  value 100nF  [1206]  (hidden comment: 100nF 100V)
C602  EEUFR1V331U  [CAPPRD500W60D1000H1250]  (value not drawn)
C603  EEUFR1V331U  [CAPPRD500W60D1000H1250]  (value not drawn)
C604  EEUFR1V331U  [CAPPRD500W60D1000H1250]  (value not drawn)
C605  EEUFR1V331U  [CAPPRD500W60D1000H1250]  (value not drawn)
D600  SS5P6-M3/86A  [TO-277A(SMPC)]
L600  value 100uH  [L_2SMD_8x8.5x5MM_NS]  (hidden comment: 100uH 2.5A)
VR600  LM2576HVT  -12V  [TO170P1067X483X1651-5]

### Ports
-12V_OUT (out, see 000_HIERARCHICAL[2D]), VIN_DC (in, see 000_HIERARCHICAL[2D], 100_AC_DC[4B], 200_BUCK_12V[2B], 300_BUCK_5V[2A], 400_BUCK_3V3[1B], 500_BUCK_ADJ[2B])

### Nets
GND: C600.N C601.2 C602.P C603.P C604.P C605.P L600.2 VR600.4(FEEDBACK)
NetC100_1: C600.P C601.1 VR600.1(VIN) ; port VIN_DC
NetC602_N: C602.N C603.N C604.N C605.N D600.A1(A) D600.A2(A__1) VR600.3(GROUND) VR600.5(~{ON}/OFF) ; port -12V_OUT
NetD600_K: D600.K(C) L600.1 VR600.2(OUTPUT)

### Notes on the sheet
- Title:
- Project:
- File:
- Revision:
- Date:
- Size:
- A4
- Drawn by:

### Library data of the parts
C600 = EEUFR1H561B: as C202 on sheet 200_BUCK_12V; Package: None; Price: None; Value: *; MP: EEUFR1H561B; Availability: Unavailable
C601 = Cap_0.1uF_1206_100V: as C106 on sheet 100_AC_DC; Supplier 1: Digi-Key; Supplier Part Number 1: 1276-1151-1-ND; Last modified by: J.Jaramillo; Last modified date: 20240309; ComponentLink1Description: Digi-Key; ComponentLink1URL: https://www.digikey.com/en/products/detail/samsung-electro-mechanics/CL31B104KCFNNNE/3886809
C602-C605 = EEUFR1V331U: as C201 on sheet 200_BUCK_12V; Check_prices: https://www.snapeda.com/parts/EEUFR1V331U/Panasonic/view-part/?ref=eda; Value: *; Purchase-URL: https://pricing.snapeda.com/search/part/EEUFR1V331U/?ref=eda; Price: None; MP: EEUFR1V331U; SnapEDA_Link: https://www.snapeda.com/parts/EEUFR1V331U/Panasonic/view-part/?ref=snap; Availability: In Stock; Package: RADIAL-2 Panasonic
D600 = SS5P6-M3/86A: Diode,Schottky Barrier,Vr 60V,If 5A,Pkg TO-277A,Vf 0.56V,Cj 200pF,Tj +150degc | General Semiconductor / Vishay SS5P6-M3/86A; MF: Vishay General Semiconductor; SnapEDA_Link: https://www.snapeda.com/parts/SS5P6-M3/86A/Vishay/view-part/?ref=snap; Package: TO-277 Vishay; Value: *; MP: SS5P6-M3/86A; Check_prices: https://www.snapeda.com/parts/SS5P6-M3/86A/Vishay/view-part/?ref=eda
L600 = L_100uH_2.5A_NS: 2.5A 100uH ±20% 3A SMD,8x8.5mm Power Inductors ROHS; Manufacturer: PROD Tech; Manufacturer Part Number: PSPMAA0805-101M-ANP; Supplier 1: LCSC; Supplier Part Number 1: C2962892; Reel Stock: N/A; Last modified by: J.Jaramillo; Last modified date: 20240310; ComponentLink1Description: Digi-Key; ComponentLink1URL: https://www.digikey.com/en/products/detail/bourns-inc/SRR1280-101M/2127044
VR600 = LM2576HVT-ADJ/NOPB: SIMPLE SWITCHERÂ® 4V to 60V, 3A Low Component Count Step-Down Regulator; MF: Texas Instruments; SnapEDA_Link: https://www.snapeda.com/parts/LM2576HVT-ADJ/NOPB/Texas+Instruments/view-part/?ref=snap; Package: TO-220-5 Texas Instruments; Value: *; MP: LM2576HVT-ADJ/NOPB; Check_prices: https://www.snapeda.com/parts/LM2576HVT-ADJ/NOPB/Texas+Instruments/view-part/?ref=eda

## Nets that join several sheets
GND: 000_HIERARCHICAL (15 pins), 100_AC_DC (12 pins), 200_BUCK_12V (6 pins), 300_BUCK_5V (6 pins), 400_BUCK_3V3 (6 pins), 500_BUCK_ADJ (8 pins), 600_INV_N12V (8 pins)
3V3_INT: 000_HIERARCHICAL (F3.2), 400_BUCK_3V3 (C401.P C402.P L400.2 U400.6)
NetC100_1: 100_AC_DC (11 pins), 200_BUCK_12V (5 pins), 300_BUCK_5V (5 pins), 400_BUCK_3V3 (C403.P C404.1 R400.2 U400.2), 500_BUCK_ADJ (C504.P C505.1 R500.2 U500.2), 600_INV_N12V (C600.P C601.1 VR600.1)
NetC201_P: 000_HIERARCHICAL (F1.1), 200_BUCK_12V (C201.P L200.2 U200.6)
NetC301_P: 000_HIERARCHICAL (F2.1), 300_BUCK_5V (C301.P L300.2 U300.6)
NetC501_P: 000_HIERARCHICAL (F4.1), 500_BUCK_ADJ (5 pins)
NetC602_N: 000_HIERARCHICAL (F5.1), 600_INV_N12V (8 pins)